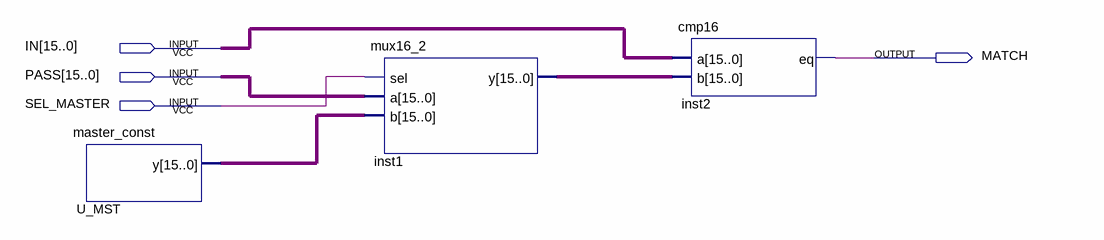
[diagram p0: schematic sheet]
// Quartus schematic compare_block.bdf as structural Verilog: 3 symbols, 4 pins
module compare_block (
  input  [15:0] IN,
  input  [15:0] PASS,
  input  SEL_MASTER,
  output MATCH
);

  wire [15:0] inst1_y, U_MST_y;

  master_const U_MST (.y(U_MST_y));
  mux16_2 inst1 (.sel(SEL_MASTER), .a(PASS), .b(U_MST_y), .y(inst1_y));
  cmp16 inst2 (.a(IN), .b(inst1_y), .eq(MATCH));
endmodule
